# Altium schematic sheet MCU.SchDoc
size A3; SheetNumber: 2; SheetTotal: 6
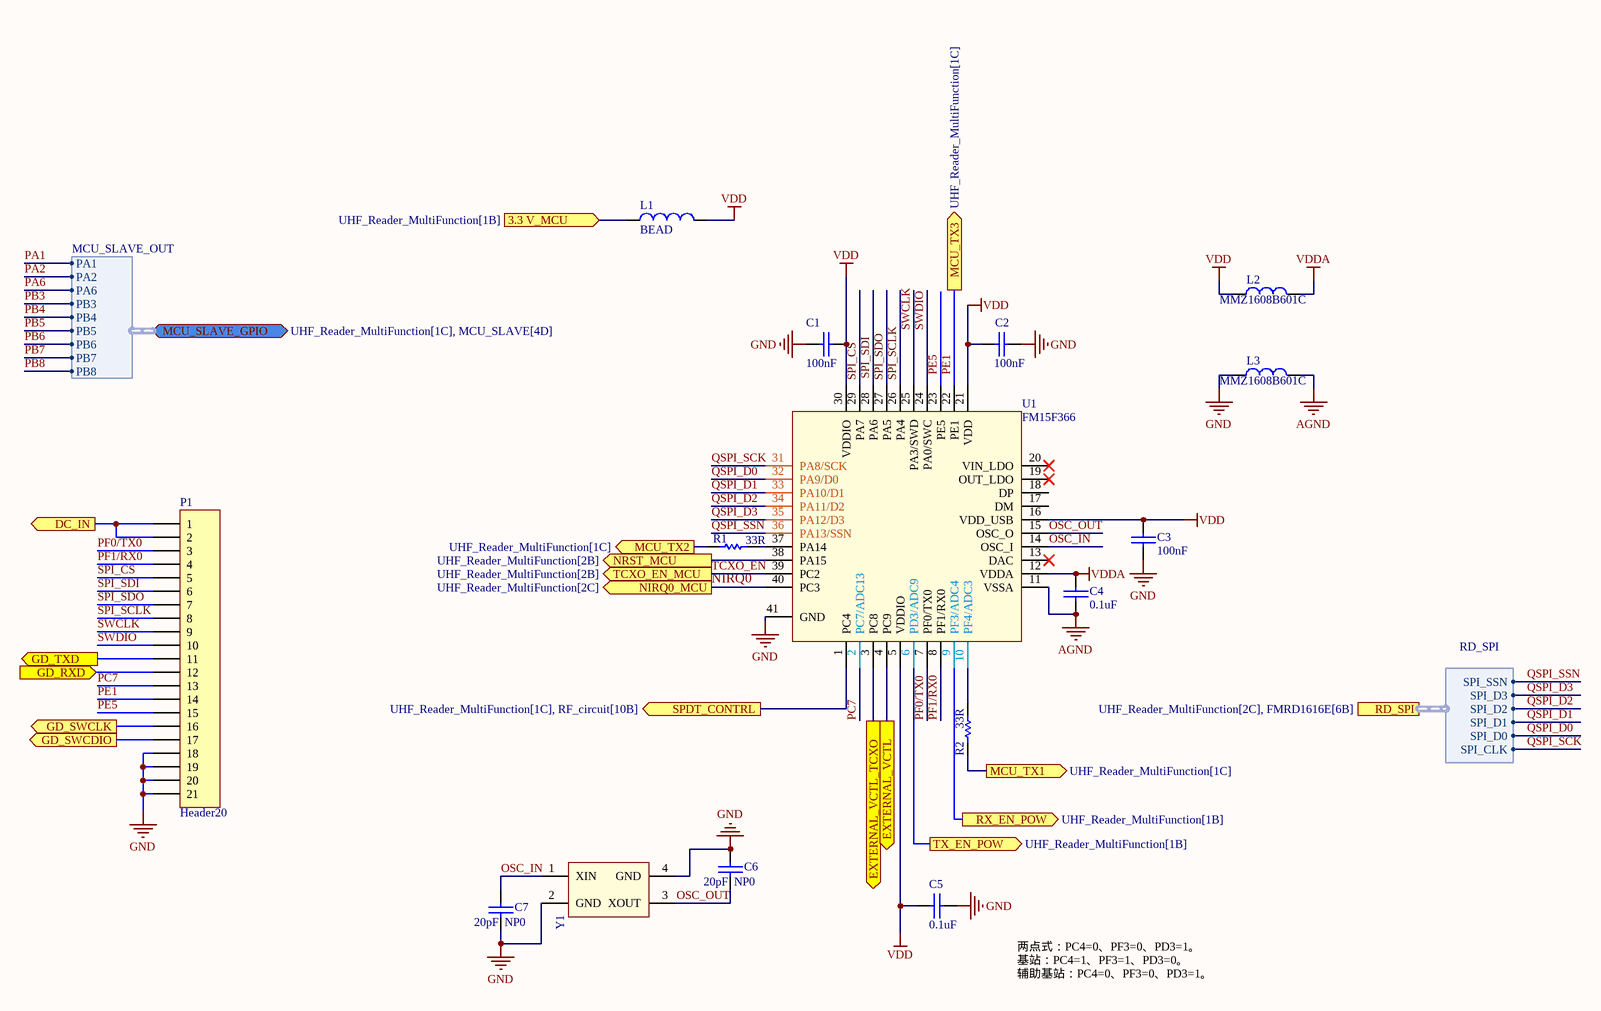
[diagram p0: MCU.SchDoc]

## Parts
C1  100nF  [0402_Z]
C2  100nF  [0402_Z]
C3  100nF  [0402_Z]
C4  0.1uF  [0402_Z]
C5  0.1uF  [0402_Z]
C6  20pF  NP0  [0402_Z]
C7  20pF  NP0  [0402_Z]
L1  BEAD  [0603_Z]
L2  MMZ1608B601C  [0402_Z]
L3  MMZ1608B601C  [0402_Z]
P1  Header20  [Header20]
R1  33R  [0402_Z]
R2  33R  [0402_Z]
U1  FM15F366  [QFN40 5X5X04P]
Y1  12MHz无源晶振  [XTAL_2520]  (value not drawn)

## Ports
3.3 V_MCU (in, see UHF_Reader_MultiFunction[1B]), DC_IN (out, see UHF_Reader_MultiFunction[1B], Power_Sch[4A]), EXTERNAL_VCTL (out), EXTERNAL_VCTL_TCXO (out), GD_RXD (in), GD_SWCDIO (out, see UHF_Reader_MultiFunction[1C]), GD_SWCLK (out, see UHF_Reader_MultiFunction[1C], MCU_SLAVE[3C]), GD_TXD (out), MCU_SLAVE_GPIO (bidir, harness MCU_SLAVE_OUT, see UHF_Reader_MultiFunction[1C], MCU_SLAVE[4D]), MCU_TX1 (out, see UHF_Reader_MultiFunction[1C]), MCU_TX2 (out, see UHF_Reader_MultiFunction[1C]), MCU_TX3 (out, see UHF_Reader_MultiFunction[1C]), NIRQ0_MCU (out, see UHF_Reader_MultiFunction[2C]), NRST_MCU (out, see UHF_Reader_MultiFunction[2B]), RD_SPI (harness RD_SPI, see UHF_Reader_MultiFunction[2C], FMRD1616E[6B]), RX_EN_POW (out, see UHF_Reader_MultiFunction[1B]), SPDT_CONTRL (out, see UHF_Reader_MultiFunction[1C], RF_circuit[10B]), TCXO_EN_MCU (out, see UHF_Reader_MultiFunction[2B]), TX_EN_POW (out, see UHF_Reader_MultiFunction[1B])

## Harnesses
RD_SPI: SPI_CLK, SPI_D0, SPI_D1, SPI_D2, SPI_D3, SPI_SSN
MCU_SLAVE_OUT: PA1, PA2, PA6, PB3, PB4, PB5, PB6, PB7, PB8

## Nets
AGND: C4.2 L3.2 U1.11(VSSA)
GND: C1.2 C2.2 C3.1 C5.2 C6.2 C7.1 L3.1 P1.18 P1.19 P1.20 P1.21 U1.41(GND) Y1.2(GND) Y1.4(GND)
VDD: C1.1 C2.1 C3.2 C5.1 L1.2 L2.1 U1.5(VDDIO) U1.16(VDD_USB) U1.21(VDD) U1.30(VDDIO)
VDDA: C4.1 L2.2 U1.12(VDDA)
3.3 V_MCU: L1.1 ; port 3.3 V_MCU
DC_IN: P1.1 P1.2 ; port DC_IN
EXTERNAL_VCTL: U1.4(PC9) ; port EXTERNAL_VCTL
EXTERNAL_VCTL_TCXO: U1.3(PC8) ; port EXTERNAL_VCTL_TCXO
GD_RXD: P1.12 ; port GD_RXD
GD_SWCDIO: P1.17 ; port GD_SWCDIO
GD_SWCLK: P1.16 ; port GD_SWCLK
GD_TXD: P1.11 ; port GD_TXD
MCU_TX1: R2.1 ; port MCU_TX1
MCU_TX2: R1.2 ; port MCU_TX2
NIRQ0: U1.40(PC3) ; port NIRQ0_MCU
NRST_MCU: U1.38(PA15) ; port NRST_MCU
OSC_IN: C7.2 U1.14(OSC_I) Y1.1(XIN)
OSC_OUT: C6.1 U1.15(OSC_O) Y1.3(XOUT)
PA1: port MCU_SLAVE_GPIO.PA1
PA2: port MCU_SLAVE_GPIO.PA2
PA6: port MCU_SLAVE_GPIO.PA6
PB3: port MCU_SLAVE_GPIO.PB3
PB4: port MCU_SLAVE_GPIO.PB4
PB5: port MCU_SLAVE_GPIO.PB5
PB6: port MCU_SLAVE_GPIO.PB6
PB7: port MCU_SLAVE_GPIO.PB7
PB8: port MCU_SLAVE_GPIO.PB8
PC7: P1.13 U1.2(PC7/ADC13)
PE1: P1.14 U1.22(PE1) ; port MCU_TX3
PE5: P1.15 U1.23(PE5)
PF0/TX0: P1.3 U1.7(PF0/TX0)
PF1/RX0: P1.4 U1.8(PF1/RX0)
QSPI_D0: U1.32(PA9/D0) ; port RD_SPI.SPI_D0
QSPI_D1: U1.33(PA10/D1) ; port RD_SPI.SPI_D1
QSPI_D2: U1.34(PA11/D2) ; port RD_SPI.SPI_D2
QSPI_D3: U1.35(PA12/D3) ; port RD_SPI.SPI_D3
QSPI_SCK: U1.31(PA8/SCK) ; port RD_SPI.SPI_CLK
QSPI_SSN: U1.36(PA13/SSN) ; port RD_SPI.SPI_SSN
RX_EN_POW: U1.9(PF3/ADC4) ; port RX_EN_POW
SPDT_CONTRL: U1.1(PC4) ; port SPDT_CONTRL
SPI_CS: P1.5 U1.29(PA7)
SPI_SCLK: P1.8 U1.26(PA4)
SPI_SDI: P1.6 U1.28(PA6)
SPI_SDO: P1.7 U1.27(PA5)
SWCLK: P1.9 U1.25(PA3/SWD)
SWDIO: P1.10 U1.24(PA0/SWC)
TCXO_EN: U1.39(PC2) ; port TCXO_EN_MCU
TX_EN_POW: U1.6(PD3/ADC9) ; port TX_EN_POW
NetR1_1: R1.1 U1.37(PA14)
NetR2_2: R2.2 U1.10(PF4/ADC3)

Not connected (* = marked no-connect by the designer): U1 13(DAC)* 17(DM) 18(DP) 19(OUT_LDO)* 20(VIN_LDO)*

## Notes on the sheet
- 两点式：PC4=0、PF3=0、PD3=1。
  基站：PC4=1、PF3=1、PD3=0。
  辅助基站：PC4=0、PF3=0、PD3=1。

## Library data of the parts
C1-C3 = CAP: 0402; Value: 0.1uF
C4-C7 = CAP: 0402
  C4 C5: Value: 0.1uF
  C6 C7: Value: 20pF  NP0
L1 = Inductor: Code_IEC: 1005; Value: 10mH; Published: 8-Jun-2000; LatestRevisionDate: 29-May-2009; LatestRevisionNote: IPC-7351 Footprint Added.; PackageReference: 0402-A; Publisher: Altium Limited; PackageDescription: Chip Inductor; Code_JEITA: 0402
L2 L3 = INDUCTOR1: INDUCTOR; Value: ?nH
R1 R2 = Res: 0402; Value: 100R; Published: 8-Jun-2000; Revision: July-2002: Re-released for DXP Platform.; Publisher: Altium Limited
U1 = FM399_QFN40
Y1 = XTAL 3225: PCB DECAL: 3225; Source_Path: E:\LI LELE\DESIGN KIT\DESIGN KIT_ESP8089_DEMO\ESP8089_DEMO.DSN